# Altium schematic sheet 10 USB2.0 HUB&PCIe.SchDoc
size A3; Revision: V1.2; SheetNumber: 10; SheetTotal: 11
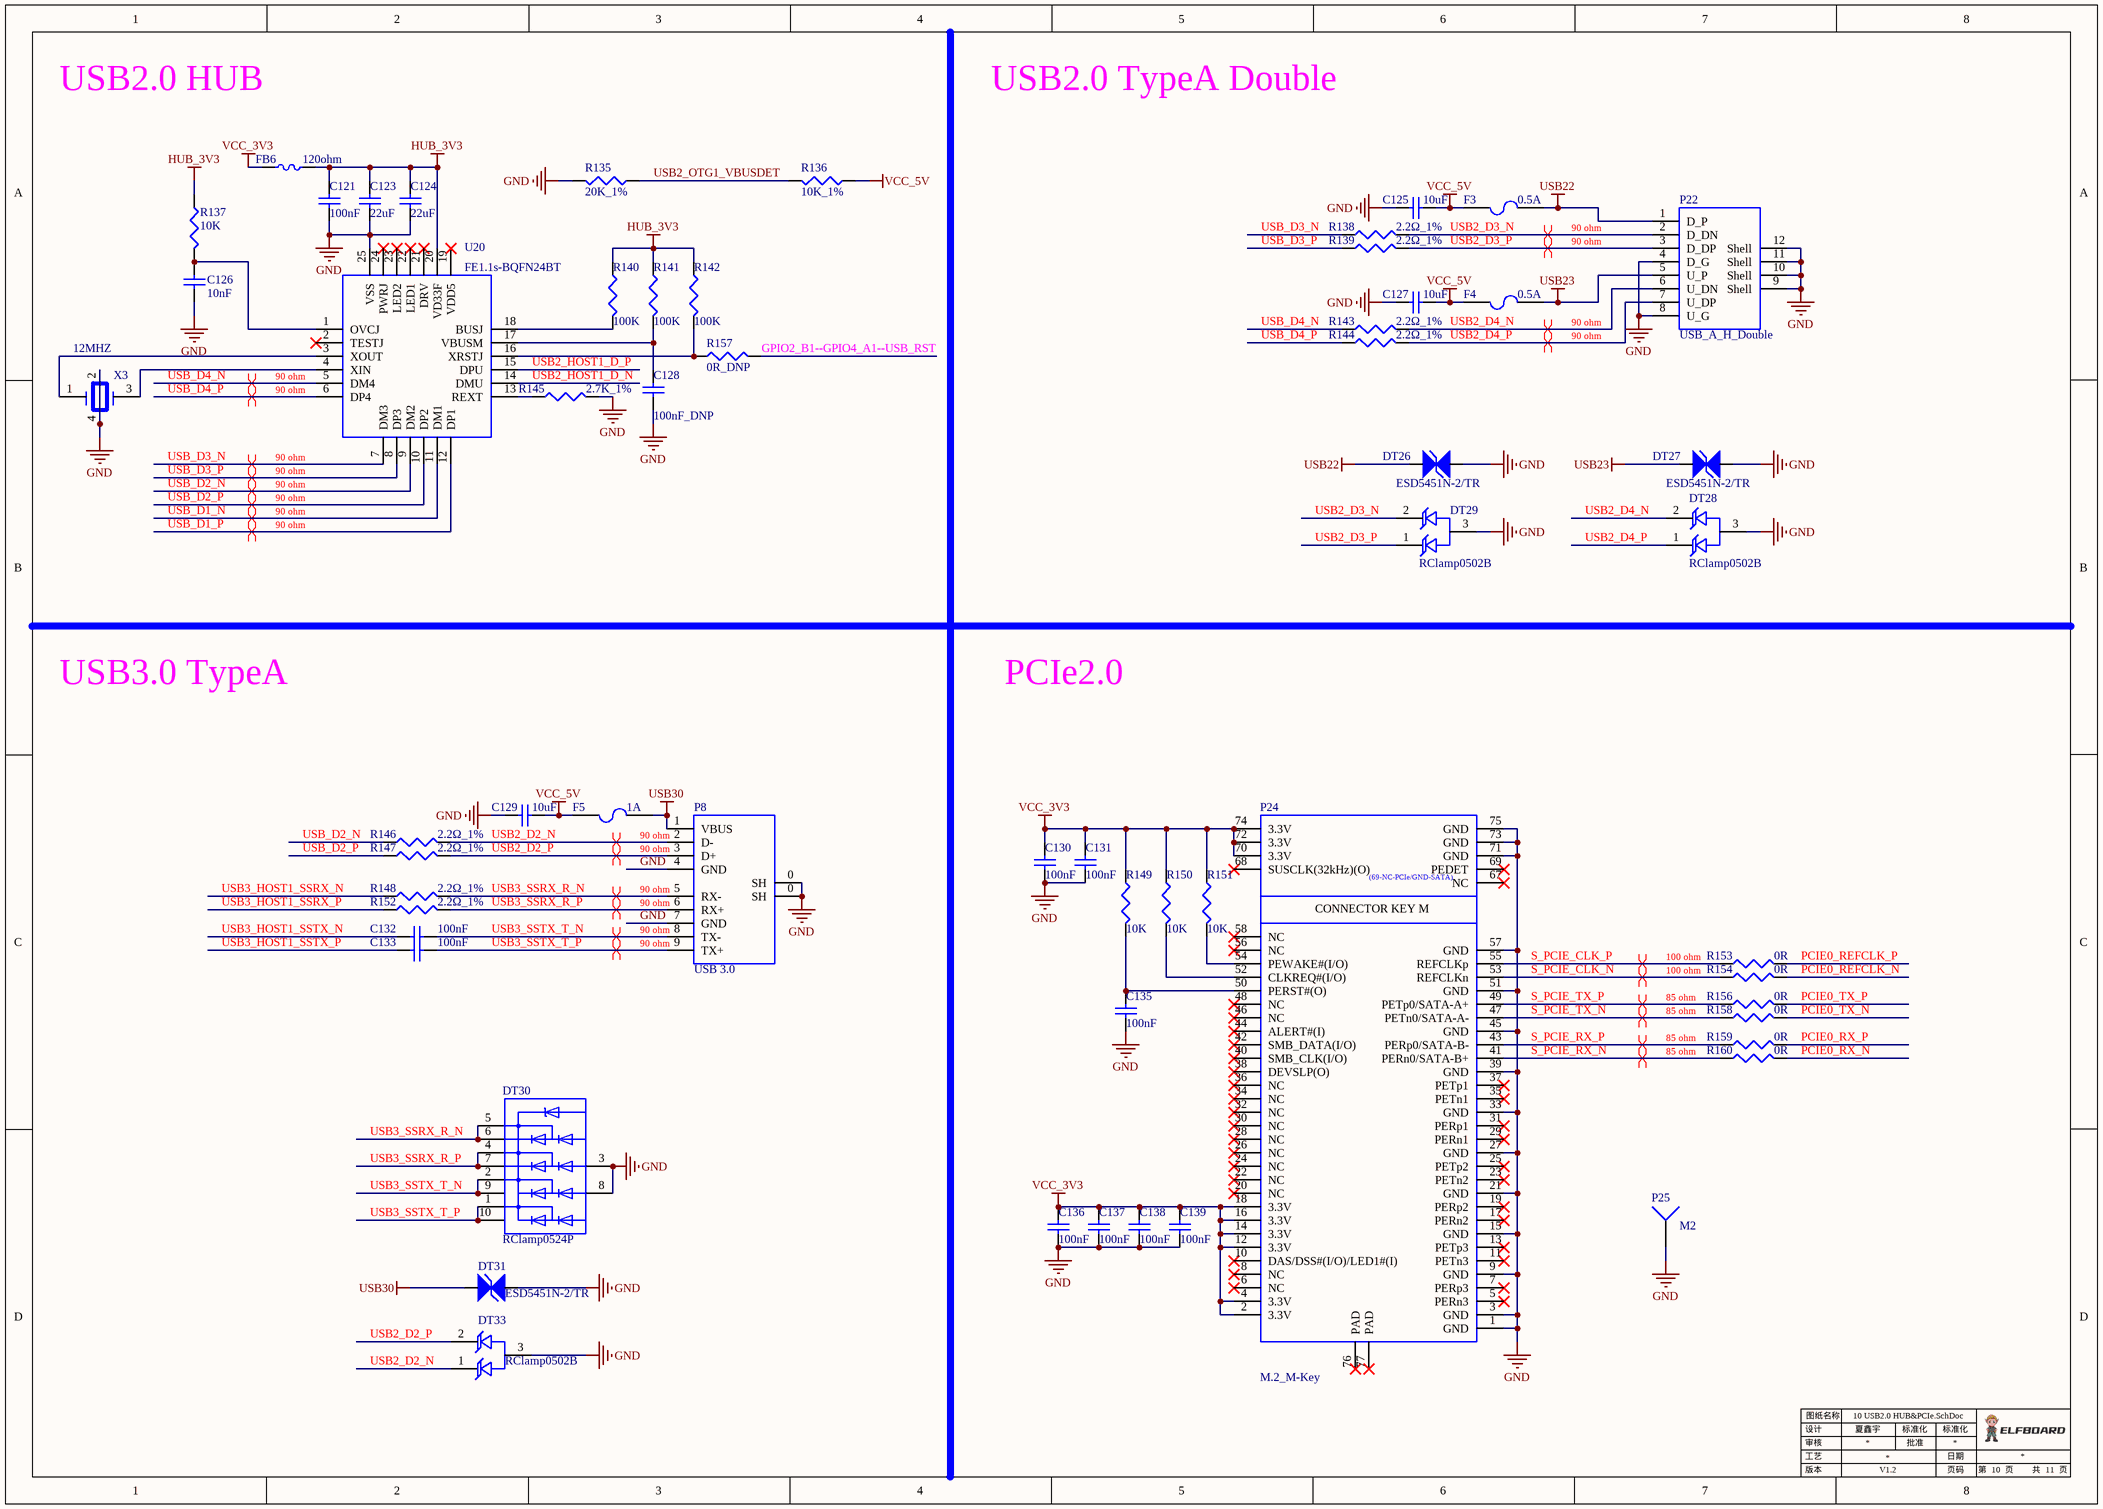
[diagram p0: 10 USB2.0 HUB&PCIe.SchDoc]

## Parts
C121  100nF  [0402C]
C123  22uF  [0603C]
C124  22uF  [0603C]
C125  10uF  [0603C]
C126  10nF  [0402C]
C127  10uF  [0603C]
C128  100nF_DNP  [0402C]
C129  10uF  [0603C]
C130  100nF  [0402C]
C131  100nF  [0402C]
C132  100nF  [0402C]
C133  100nF  [0402C]
C135  100nF  [0402C]
C136  100nF  [0402C]
C137  100nF  [0402C]
C138  100nF  [0402C]
C139  100nF  [0402C]
DT26  ESD5451N-2/TR  [0402TVS]
DT27  ESD5451N-2/TR  [0402TVS]
DT28  RClamp0502B  [SOT_523]
DT29  RClamp0502B  [SOT_523]
DT30  RClamp0524P  [DFN_10L]
DT31  ESD5451N-2/TR  [0402TVS]
DT33  RClamp0502B  [SOT_523]
F3  0.5A  [1210F]
F4  0.5A  [1210F]
F5  1A  [1210F]
FB6  120ohm  [0603L]
P8  USB 3.0  [USB3.0_A-11.78]
P22  USB_A_H_Double  [USB_A_F_W_2]
P24  M.2_M-Key  [M.2_M-Key]
P25  M2  [HOLE3.6-5.6]
R135  20K_1%  [0402R]
R136  10K_1%  [0402R]
R137  10K  [0402R]
R138  2.2Ω_1%  [0402R]
R139  2.2Ω_1%  [0402R]
R140  100K  [0402R]
R141  100K  [0402R]
R142  100K  [0402R]
R143  2.2Ω_1%  [0402R]
R144  2.2Ω_1%  [0402R]
R145  2.7K_1%  [0402R]
R146  2.2Ω_1%  [0402R]
R147  2.2Ω_1%  [0402R]
R148  2.2Ω_1%  [0402R]
R149  10K  [0402R]
R150  10K  [0402R]
R151  10K  [0402R]
R152  2.2Ω_1%  [0402R]
R153  0R  [0402R]
R154  0R  [0402R]
R156  0R  [0402R]
R157  0R_DNP  [0402R]
R158  0R  [0402R]
R159  0R  [0402R]
R160  0R  [0402R]
U20  FE1.1s-BQFN24BT  [QFN24_0.5BSC_4.15*4.15]
X3  12MHZ  [Crystals_3225]

## Nets
GND: C121.1 C123.1 C124.1 C125.1 C126.1 C127.1 C128.1 C129.1 C130.1 C131.1 C135.1 C136.1 C137.1 C138.1 C139.1 DT26.1 DT27.1 DT28.3 DT29.3 DT30.3 DT30.8 DT31.1 DT33.3 P8.0(SH) P8.4(GND) P8.7(GND) P22.4(D_G) P22.8(U_G) P22.9(Shell) P22.10(Shell) P22.11(Shell) P22.12(Shell) P24.1(GND) P24.3(GND) P24.9(GND) P24.15(GND) P24.21(GND) P24.27(GND) P24.33(GND) P24.39(GND) P24.45(GND) P24.51(GND) P24.57(GND) P24.71(GND) P24.73(GND) P24.75(GND) P25.1 R135.2 R145.2 U20.25(VSS) X3.2 X3.4
HUB_3V3: C121.2 C123.2 C124.2 FB6.2 R137.1 R140.1 R141.1 R142.1 U20.20(VD33F)
USB22: DT26.2 F3.1 P22.1(D_P)
USB23: DT27.2 F4.1 P22.5(U_P)
USB30: DT31.2 F5.1 P8.1(VBUS)
VCC_3V3: C130.2 C131.2 C136.2 C137.2 C138.2 C139.2 FB6.1 P24.2(3.3V) P24.4(3.3V) P24.12(3.3V) P24.14(3.3V) P24.16(3.3V) P24.18(3.3V) P24.70(3.3V) P24.72(3.3V) P24.74(3.3V) R149.1 R150.1 R151.1
VCC_5V: C125.2 C127.2 C129.2 F3.2 F4.2 F5.2 R136.1
GPIO2_B1--GPIO4_A1--USB_RST: R157.2
PCIE0_REFCLK_N: R154.2
PCIE0_REFCLK_P: R153.2
PCIE0_RX_N: R160.2
PCIE0_RX_P: R159.2
PCIE0_TX_N: R158.2
PCIE0_TX_P: R156.2
S_PCIE_CLK_N: P24.53(REFCLKn) R154.1
S_PCIE_CLK_P: P24.55(REFCLKp) R153.1
S_PCIE_RX_N: P24.41(PERn0/SATA-B+) R160.1
S_PCIE_RX_P: P24.43(PERp0/SATA-B-) R159.1
S_PCIE_TX_N: P24.47(PETn0/SATA-A-) R158.1
S_PCIE_TX_P: P24.49(PETp0/SATA-A+) R156.1
USB2_D2_N: DT33.1 P8.2(D-) R146.2
USB2_D2_P: DT33.2 P8.3(D+) R147.2
USB2_D3_N: DT29.2 P22.2(D_DN) R138.2
USB2_D3_P: DT29.1 P22.3(D_DP) R139.2
USB2_D4_N: DT28.2 P22.6(U_DN) R143.2
USB2_D4_P: DT28.1 P22.7(U_DP) R144.2
USB2_HOST1_D_N: U20.14(DMU)
USB2_HOST1_D_P: U20.15(DPU)
USB2_OTG1_VBUSDET: R135.1 R136.2
USB3_HOST1_SSRX_N: R148.1
USB3_HOST1_SSRX_P: R152.1
USB3_HOST1_SSTX_N: C132.1
USB3_HOST1_SSTX_P: C133.1
USB3_SSRX_R_N: DT30.5 DT30.6 P8.5(RX-) R148.2
USB3_SSRX_R_P: DT30.4 DT30.7 P8.6(RX+) R152.2
USB3_SSTX_T_N: C132.2 DT30.2 DT30.9 P8.8(TX-)
USB3_SSTX_T_P: C133.2 DT30.1 DT30.10 P8.9(TX+)
USB_D1_N: U20.11(DM1)
USB_D1_P: U20.12(DP1)
USB_D2_N: R146.1 U20.9(DM2)
USB_D2_P: R147.1 U20.10(DP2)
USB_D3_N: R138.1 U20.7(DM3)
USB_D3_P: R139.1 U20.8(DP3)
USB_D4_N: R143.1 U20.5(DM4)
USB_D4_P: R144.1 U20.6(DP4)
NetC126_2: C126.2 R137.2 U20.1(OVCJ)
NetC128_2: C128.2 R141.2 U20.17(VBUSM)
NetC135_2: C135.2 P24.50(PERST#(O)) R149.2
NetP24_52: P24.52(CLKREQ#(I/O)) R150.2
NetP24_54: P24.54(PEWAKE#(I/O)) R151.2
NetR140_2: R140.2 U20.18(BUSJ)
NetR142_2: R142.2 R157.1 U20.16(XRSTJ)
NetR145_1: R145.1 U20.13(REXT)
NetU20_3: U20.3(XOUT) X3.1
NetU20_4: U20.4(XIN) X3.3

Not connected (* = marked no-connect by the designer): P24 5(PERn3)* 6(NC)* 7(PERp3)* 8(NC)* 10(DAS/DSS#(I/O)/LED1#(I))* 11(PETn3)* 13(PETp3)* 17(PERn2)* 19(PERp2)* 20(NC)* 22(NC)* 23(PETn2)* 24(NC)* 25(PETp2)* 26(NC)* 28(NC)* 29(PERn1)* 30(NC)* 31(PERp1)* 32(NC)* 34(NC)* 35(PETn1)* 36(NC)* 37(PETp1)* 38(DEVSLP(O))* 40(SMB_CLK(I/O))* 42(SMB_DATA(I/O))* 44(ALERT#(I))* 46(NC)* 48(NC)* 56(NC)* 58(NC)* 67(NC)* 68(SUSCLK(32kHz)(O))* 69(PEDET)* 76(PAD)* 77(PAD)*; U20 2(TESTJ)* 19(VDD5)* 21(DRV)* 22(LED1)* 23(LED2)* 24(PWRJ)*

## Layout directives
differential pair; differential pair class 100 ohm: S_PCIE_CLK_N, S_PCIE_CLK_P
differential pair; differential pair class 90 ohm: USB2_D2_N, USB2_D2_P, USB2_D3_N, USB2_D3_P, USB2_D4_N, USB2_D4_P, USB3_SSRX_R_N, USB3_SSRX_R_P, USB3_SSTX_T_N, USB3_SSTX_T_P, USB_D1_N, USB_D1_P, USB_D2_N, USB_D2_P, USB_D3_N, USB_D3_P, USB_D4_N, USB_D4_P
differential pair; differential pair class 85 ohm: S_PCIE_RX_N, S_PCIE_RX_P, S_PCIE_TX_N, S_PCIE_TX_P

## Notes on the sheet
- USB2.0 HUB
- USB2.0 TypeA Double
- USB3.0 TypeA
- PCIe2.0
- 设计
- 审核
- 工艺
- 图纸名称
- 夏鑫宇
- 批准
- 标准化
- 日期
- 版本
- 页码
- 第
- 页
- 共
- (in symbol 1120201185) (69-NC-PCIe/GND-SATA); CONNECTOR KEY M

## Library data of the parts
C121 C128 C130 C131 C135-C139 = 1110202039: 序号: 618; 存货名称: 贴装叠层陶瓷电容; 规格型号: 0402,100nF,25V,±10％,X5R; 禁用状态: 否; Published: 8-Jun-2000; LatestRevisionDate: 17-Jul-2002; LatestRevisionNote: Re-released for DXP Platform.; PackageReference: RAD-0.3; Publisher: Altium Limited; PackageDescription: Radial Cap, Thru-Hole; 2 Leads; 0.3 in Pin Spacing; 存货编码: 1110202039
  C121 C130 C131 C135-C139: Value: 100nF
  C128: Value: 100nF_DNP
C123 C124 = 1110203040: 序号: 675; 存货名称: 贴装叠层陶瓷电容; 规格型号: 0603,22uF,6.3V,±20％,X5R; Published: 8-Jun-2000; LatestRevisionDate: 17-Jul-2002; LatestRevisionNote: Re-released for DXP Platform.; PackageReference: RAD-0.3; Publisher: Altium Limited; PackageDescription: Radial Cap, Thru-Hole; 2 Leads; 0.3 in Pin Spacing; Value: 22uF; 存货编码: 1110203040
C125 C127 C129 = 1110203089: 序号: 5456; 存货名称: 贴装叠层陶瓷电容; 规格型号: 0603,10uF,10V,±10％,X5R,0603X106K100NT; 描述: FH/广东风华高新科技股份有限公司; 禁用: #REF!; 近三年购买频次（更新至2023/12/7）: 近三年购买频次,12; Published: 8-Jun-2000; LatestRevisionDate: 17-Jul-2002; LatestRevisionNote: Re-released for DXP Platform.; PackageReference: RAD-0.3; Publisher: Altium Limited; PackageDescription: Radial Cap, Thru-Hole; 2 Leads; 0.3 in Pin Spacing; Value: 10uF; 存货编码: 1110203089; 最近一次购买记录(更新至20231207）: 2023/11/8; 料号建立日期: 2023/6/9
C126 = 1110202014: 序号: 593; 存货名称: 贴装叠层陶瓷电容; 规格型号: 0402,10nF,50V,±10％,X7R; 禁用状态: 否; Published: 8-Jun-2000; LatestRevisionDate: 17-Jul-2002; LatestRevisionNote: Re-released for DXP Platform.; PackageReference: RAD-0.3; Publisher: Altium Limited; PackageDescription: Radial Cap, Thru-Hole; 2 Leads; 0.3 in Pin Spacing; Value: 10nF; 存货编码: 1110202014
C132 C133 = 1110202001: 序号: 570; 存货名称: 贴装叠层陶瓷电容; 规格型号: 0402,100nF,16V,±10％,X7R; 禁用状态: 否; Published: 8-Jun-2000; LatestRevisionDate: 17-Jul-2002; LatestRevisionNote: Re-released for DXP Platform.; PackageReference: RAD-0.3; Publisher: Altium Limited; PackageDescription: Radial Cap, Thru-Hole; 2 Leads; 0.3 in Pin Spacing; Value: 100nF; 存货编码: 1110202001
DT26 DT27 DT31 = 1110503036: 存货名称: TVS管; 规格型号: ESD5451N-2/TR,DFN1006-2L; 禁用状态: 否; Value: ESD5451N-2/TR; 存货编码: 1110503036
DT28 DT29 = 1110503016: 序号: 2598; 存货名称: TVS管; 规格型号: RC1amp0502B SOT-523; 主计量单位名称: 只; 安全库存: 2084.00; 旧编码: 010603010; Value: RClamp0502B; 存货编码: 1110503016; 启用日期: 2013/1/1
DT30 = 1110405308: 存货名称: 常规IC; 规格型号: RClamp0524PATCT,DFN-10L; 描述栏信息: 替代1110405144; 禁用状态: 否; 存货编码: 1110405308; value: RClamp0524P
DT33 = 1110503016: 序号: 2598; 存货名称: TVS管; 规格型号: RC1amp0502B,SOT-523; 主计量单位名称: 只; 安全库存: 1767; 旧编码: 010603010; 旧规格型号: RC1amp0502B SOT-523; Value: RClamp0502B; 存货编码: 1110503016
F3 F4 = 1110305006: 序号: 1038; 存货名称: 自恢复保险; 规格型号: 1210,0.5A; 禁用: #REF!; 近三年购买频次（更新至2023/12/7）: 近三年购买频次,37; Published: 8-Jun-2000; LatestRevisionDate: 17-Jul-2002; LatestRevisionNote: Re-released for DXP Platform.; PackageReference: PIN-W2/E2.8; Publisher: Altium Limited; PackageDescription: Thru-Hole; 2 Leads; Value: 0.5A; 存货编码: 1110305006; 最近一次购买记录(更新至20231207）: 2023/12/5; 料号建立日期: 2019/7/2
F5 = 1110305004: 序号: 1036; 存货名称: 自恢复保险; 规格型号: 1210,1A; 禁用: #REF!; 近三年购买频次（更新至2023/12/7）: 近三年购买频次,4; Published: 8-Jun-2000; LatestRevisionDate: 17-Jul-2002; LatestRevisionNote: Re-released for DXP Platform.; PackageReference: PIN-W2/E2.8; Publisher: Altium Limited; PackageDescription: Thru-Hole; 2 Leads; Value: 1A; 存货编码: 1110305004; 最近一次购买记录(更新至20231207）: 2023/12/5; 料号建立日期: 2019/7/2
FB6 = 1110304011: 序号: 1028; 存货名称: 磁珠; 规格型号: 0603,120ohm,500mA,WLCB1608-120Ω; VALUE: 120ohm; 存货编码: 1110304011
P8 = 1120202208: 存货名称: 插装USB座; 规格型号: USB3.0,母座,单层,横卧,富士康; 禁用: 否; Value: USB 3.0; 存货编码: 1120202208
P22 = 1120202032: 序号: 1365; 存货名称: 插装USB座; 规格型号: USB2.0,A型,母座,双层,横卧; 存货编码: 1120202032; Value: USB_A_H_Double
P24 = 1120201185: 存货名称: M.2插槽; 规格型号: 0.5PITCH,M.2, H4.2,KEY M; Value: M.2_M-Key; 存货编码: 1120201185
P25 = 1150303024: 序号: 3308; 存货名称: 贴片螺母; 规格型号: M2mm,长2mm; 禁用: #REF!; 近三年购买频次（更新至2023/12/7）: 近三年购买频次,73; LatestRevisionDate: 17-Jul-2002; LatestRevisionNote: Re-released for DXP Platform.; Publisher: Altium Limited; Value: M2; 存货编码: 1150303024; 最近一次购买记录(更新至20231207）: 2023/12/5; 料号建立日期: 2019/7/2
R135 = 1110102074: 序号: 94; 存货名称: 贴装电阻; 规格型号: 0402,20K,±1％; 禁用状态: 否; Value: 20K_1%; 存货编码: 1110102074
R136 = 1110102037: 序号: 57; 存货名称: 贴装电阻; 规格型号: 0402,10K,±1％; 禁用状态: 否; Value: 10K_1%; 存货编码: 1110102037
R137 R149-R151 = 1110102007: 序号: 27; 存货名称: 贴装电阻; 规格型号: 0402,10K,±5％; 禁用状态: 否; Value: 10K; 存货编码: 1110102007
R138 R139 R143 R144 R146-R148 R152 = 1110102176: 存货名称: 贴装电阻; 规格型号: 0402,2.2Ω,±1％; 禁用状态: 否; Value: 2.2Ω_1%; 存货编码: 1110102176
R140-R142 = 1110102004: 序号: 24; 存货名称: 贴装电阻; 规格型号: 0402,100K,±5％; 禁用状态: 否; Value: 100K; 存货编码: 1110102004
R145 = 1110102192: 序号: 4302; 存货名称: 贴装电阻; 规格型号: 0402,2.7K,±1%; 禁用状态: 否; Value: 2.7K_1%; 存货编码: 1110102192
R153 R154 R156 R158-R160 = 1110102001: 序号: 10; 存货名称: 贴装电阻; 规格型号: 0402,0Ω,±5％; Value: 0R; 存货编码: 1110102001
R157 = 1110102001: 序号: 21; 存货名称: 贴装电阻; 规格型号: 0402,0Ω,±5％; 禁用: 否; 近三年购买频次（更新至2023/12/7）: 近三年购买频次,65; Value: 0R_DNP; 存货编码: 1110102001; 最近一次购买记录(更新至20231207）: 2023/9/25; 料号建立日期: 2019/7/2
U20 = 1110405348: 存货名称: 常规IC; 规格型号: FE1.1s-BQFN24BT,QFN-24,工业级; Value: FE1.1s-BQFN24BT; 存货编码: 1110405348
X3 = 1110601032: 序号: 3377; 存货名称: 贴装晶振; 规格型号: 无源,12MHZ,4P,3.2*2.5mm,±20ppm,20pf; Value: 12MHZ; 存货编码: 1110601032